# Altium schematic sheet Top_Sheet.SchDoc: =Projectname
size A4
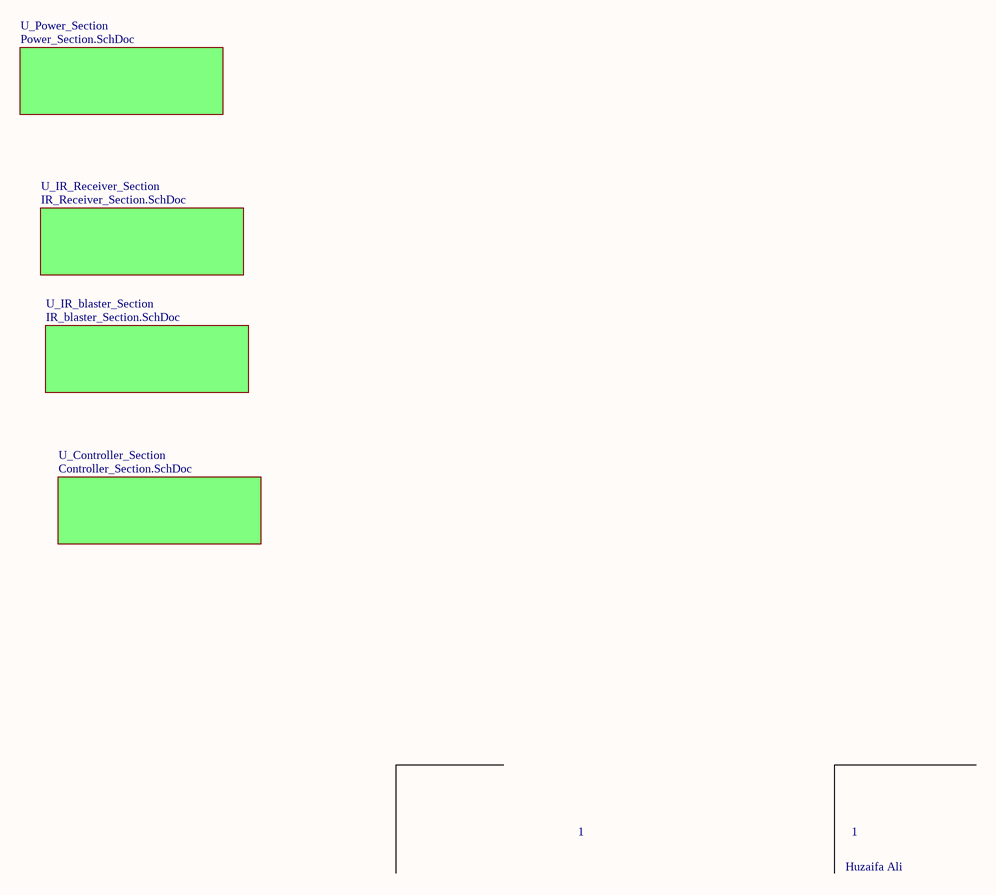
[diagram p0: Top_Sheet.SchDoc]

## Sub-sheets
U_Controller_Section = Controller_Section.SchDoc: no entries
U_IR_blaster_Section = IR_blaster_Section.SchDoc: no entries
U_IR_Receiver_Section = IR_Receiver_Section.SchDoc: no entries
U_Power_Section = Power_Section.SchDoc: no entries

## Notes on the sheet
- 1
- Huzaifa Ali